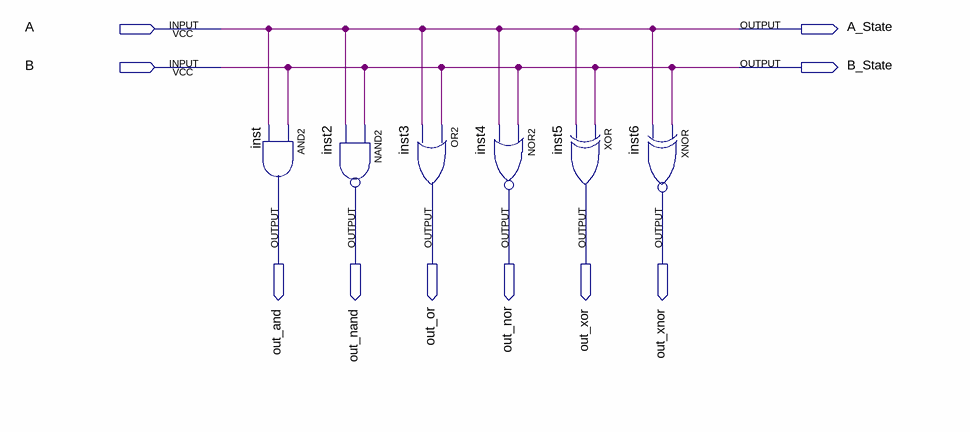
[diagram p0: schematic sheet]
// Quartus schematic basic_gates.bdf as structural Verilog: 6 symbols, 10 pins
module basic_gates (
  input  A,
  input  B,
  output A_State,
  output B_State,
  output out_and,
  output out_nand,
  output out_or,
  output out_nor,
  output out_xor,
  output out_xnor
);

  and inst (out_and, B, A);
  nand inst2 (out_nand, B, A);
  or inst3 (out_or, B, A);
  nor inst4 (out_nor, B, A);
  xor inst5 (out_xor, B, A);
  xnor inst6 (out_xnor, B, A);

  assign A_State = A;
  assign B_State = B;
endmodule
